# Altium schematic sheet Load6.SchDoc
size A4; SheetNumber: 9; SheetTotal: 15
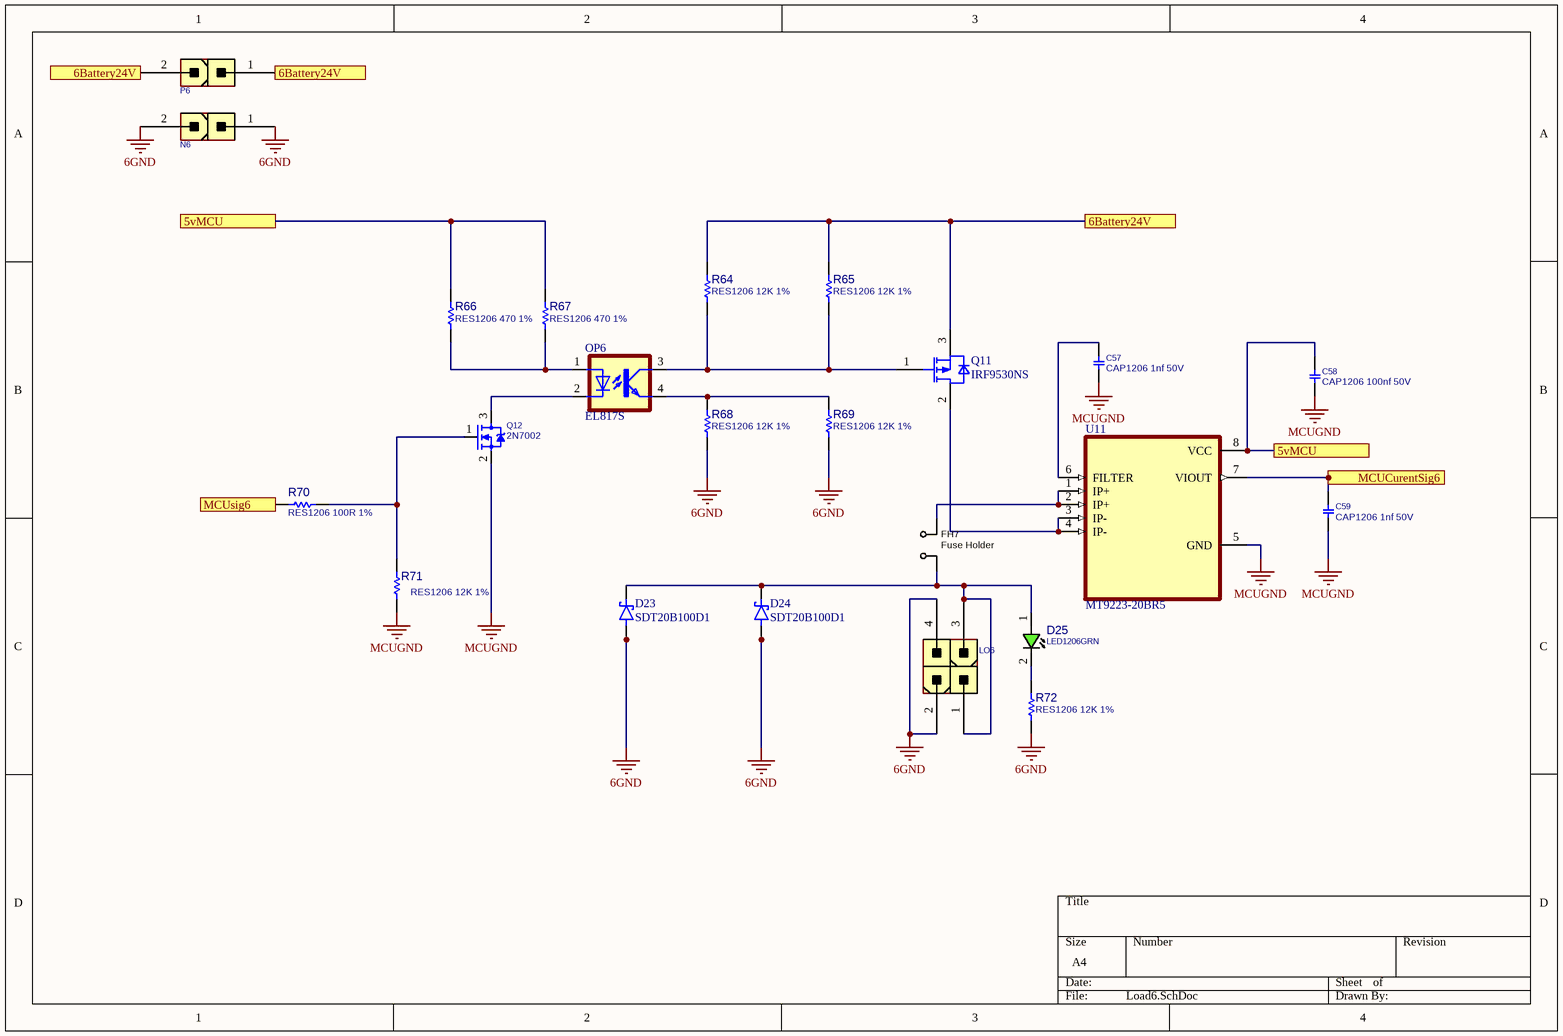
[diagram p0: Load6.SchDoc]

## Parts
C57  CAP1206 1nf 50V  [C1206]
C58  CAP1206 100nf 50V  [C1206]
C59  CAP1206 1nf 50V  [C1206]
D23  SDT20B100D1  [DPAK229P990X238-3N]
D24  SDT20B100D1  [DPAK229P990X238-3N]
D25  LED1206GRN  [LED1206GRN]
FH7  Fuse Holder  [FH_24101812]
LO6  CONN_ATXPWR_4  [ATXPWR_4]  (value not drawn)
N6  CONN_ATXPWR_2  [ATXPWR_2]  (value not drawn)
OP6  EL817S  [SOIC254P1030X460-4N]
P6  CONN_ATXPWR_2  [ATXPWR_2]  (value not drawn)
Q11  IRF9530NS  [TO254P1528X508-4_3N-V1]
Q12  2N7002  [SOT23_3]
R64  RES1206 12K 1%  [R1206]
R65  RES1206 12K 1%  [R1206]
R66  RES1206 470 1%  [R1206]
R67  RES1206 470 1%  [R1206]
R68  RES1206 12K 1%  [R1206]
R69  RES1206 12K 1%  [R1206]
R70  RES1206 100R 1%  [R1206]
R71  RES1206 12K 1%  [R1206]
R72  RES1206 12K 1%  [R1206]
U11  MT9223-20BR5  [SOIC127P600X175-8N]

## Ports
5vMCU, 6Battery24V, MCUCurentSig6, MCUsig6

## Nets
6GND: D23.1(A) D23.3(A__1) D24.1(A) D24.3(A__1) LO6.2 LO6.4 N6.1 N6.2 R68.2 R69.2 R72.2
MCUGND: C57.2 C58.2 C59.2 Q12.2(SOURCE) R71.2 U11.5(GND)
5vMCU: C58.1 R66.2 R67.2 U11.8(VCC) ; port 5vMCU
6Battery24V: P6.1 P6.2 Q11.3(SOURCE) R64.1 R65.1 ; port 6Battery24V
MCUCurentSig6: C59.1 U11.7(VIOUT) ; port MCUCurentSig6
MCUsig6: R70.1 ; port MCUsig6
NetC57_1: C57.1 U11.6(FILTER)
NetD23_4: D23.4(K) D24.4(K) D25.1(ANODE) FH7.1 LO6.1 LO6.3
NetD25_2: D25.2(CATHODE) R72.1
NetFH7_2: FH7.2 U11.1(IP+) U11.2(IP+)
NetOP6_1: OP6.1(A) R66.1 R67.1
NetOP6_2: OP6.2(C) Q12.3(DRAIN)
NetOP6_3: OP6.3(COL) Q11.1(GATE) R64.2 R65.2
NetOP6_4: OP6.4(EMIT) R68.1 R69.1
NetQ11_2: Q11.2(DRAIN) U11.3(IP-) U11.4(IP-)
NetQ12_1: Q12.1(GATE) R70.2 R71.1

## Library data of the parts
C57-C59 = CAP_SMD_MLCC_1206: CAP, MLCC; PARAM: -, -%; MANF_P#: MANF_PART#; PARAM2: -V; PRICE: 100= 1$; MANF: -; ASSEMBLY: ASSEMBLY
D23 D24 = MBRD835L: Diode Schottky 35 V 8A Surface Mount DPAK; MF: ON Semiconductor; SnapEDA_Link: https://www.snapeda.com/parts/MBRD835L/Onsemi/view-part/?ref=snap; Package: TO-252-3 MICROSS/On Semiconductor; Value: *; MP: MBRD835L; Check_prices: https://www.snapeda.com/parts/MBRD835L/Onsemi/view-part/?ref=eda
D25 = LED_SMD_1206_GRN: LED, SMD, 1206, GREEN; PARAM: 20mA; DESC: DESCRIPTION; PARAM2: 2.2V; MANF: -; ASSEMBLY: ASSEMBLY; PRICE: 36t@Javan; MANF_P#: -; VALUE: LED1206GRN; MountType: SMT; PartType: LED
FH7 = FUSE_SMD_HOLDER_24101812: Fuse SMD2410 Holder; PARAM: max. 10A; MANF: Littelfuse; MANF_P#: 01550900M; PARAM2: 125v; PRICE: 0.2$; PACKAGE: SMD,5.0x9.7mm; VALUE: Fuse Holder
LO6 = CONN_ATXPWR_4: CONN, ATX POWER, 4 P; MANF: TE, Molex; MANF_P#: 4-1775099-0, 39281043; VALUE: CONN_ATXPWR_4; MountType: THD; PACKAGE: ATXPWR-4pin; Part Type: Conn.
N6 P6 = CONN_ATXPWR_2: CONN, ATX POWER, 2 P; MANF: Molex; MANF_P#: 39281023; VALUE: CONN_ATXPWR_2; MountType: THD; PACKAGE: ATXPWR-2pin; Part Type: Conn.
OP6 = EL817S: Optoisolator Transistor Output 5000Vrms 1 Channel 4-SMD; MF: Everlight Electronics; SnapEDA_Link: https://www.snapeda.com/parts/EL817S/Everlight+Electronics+Co+Ltd/view-part/?ref=snap; Package: SMD-4 Everlight Electronics Co Ltd; Value: *; MP: EL817S; Check_prices: https://www.snapeda.com/parts/EL817S/Everlight+Electronics+Co+Ltd/view-part/?ref=eda
Q11 = IRF9530NS: OptiMOS - P2 Power-Transistor, P-channel-Enhancement mode, VDS -30V; Manufacturer: Infineon Technologies; Manufacturer Order NumberManufacturer Order Number: IRF9530NS; PackageReference: PG-TO263-3-901
Q12 = MOSN_2N7002_SOT23: MOSFET, N-CH, 60V, 0.3A; MANF: NXP; ASSEMBLY: ASSEMBLY; MANF_P#: 2N7002; PARAM2: 60v; PARAM: 0.3A; PRICE: 0.3t@Javan; VALUE: 2N7002
R64-R72 = RES_SMD_1206: RESISTOR, SMD; PARAM: 1%, 0.25W; DESC: DESCRIPTION; DIST#: MOUSER; MANF_P#: -; MANF: -; ASSEMBLY: ASSEMBLY; PRICE: -; PARAM2: -
U11 = ACS712ELCTR-05B-T: MF: {'manufacturer': u'Allegro MicroSystems'}; Package: None; Price: None; Value: *; MP: ACS712ELCTR-05B-T; Availability: Unavailable